# Altium project Pukk-Sensor-Module-v1.0.PrjPcb (part 4 of 6)

## Sheet CAN-Sheet.SchDoc
size 420 x 297 mm; SheetNumber: 6; SheetTotal: 8
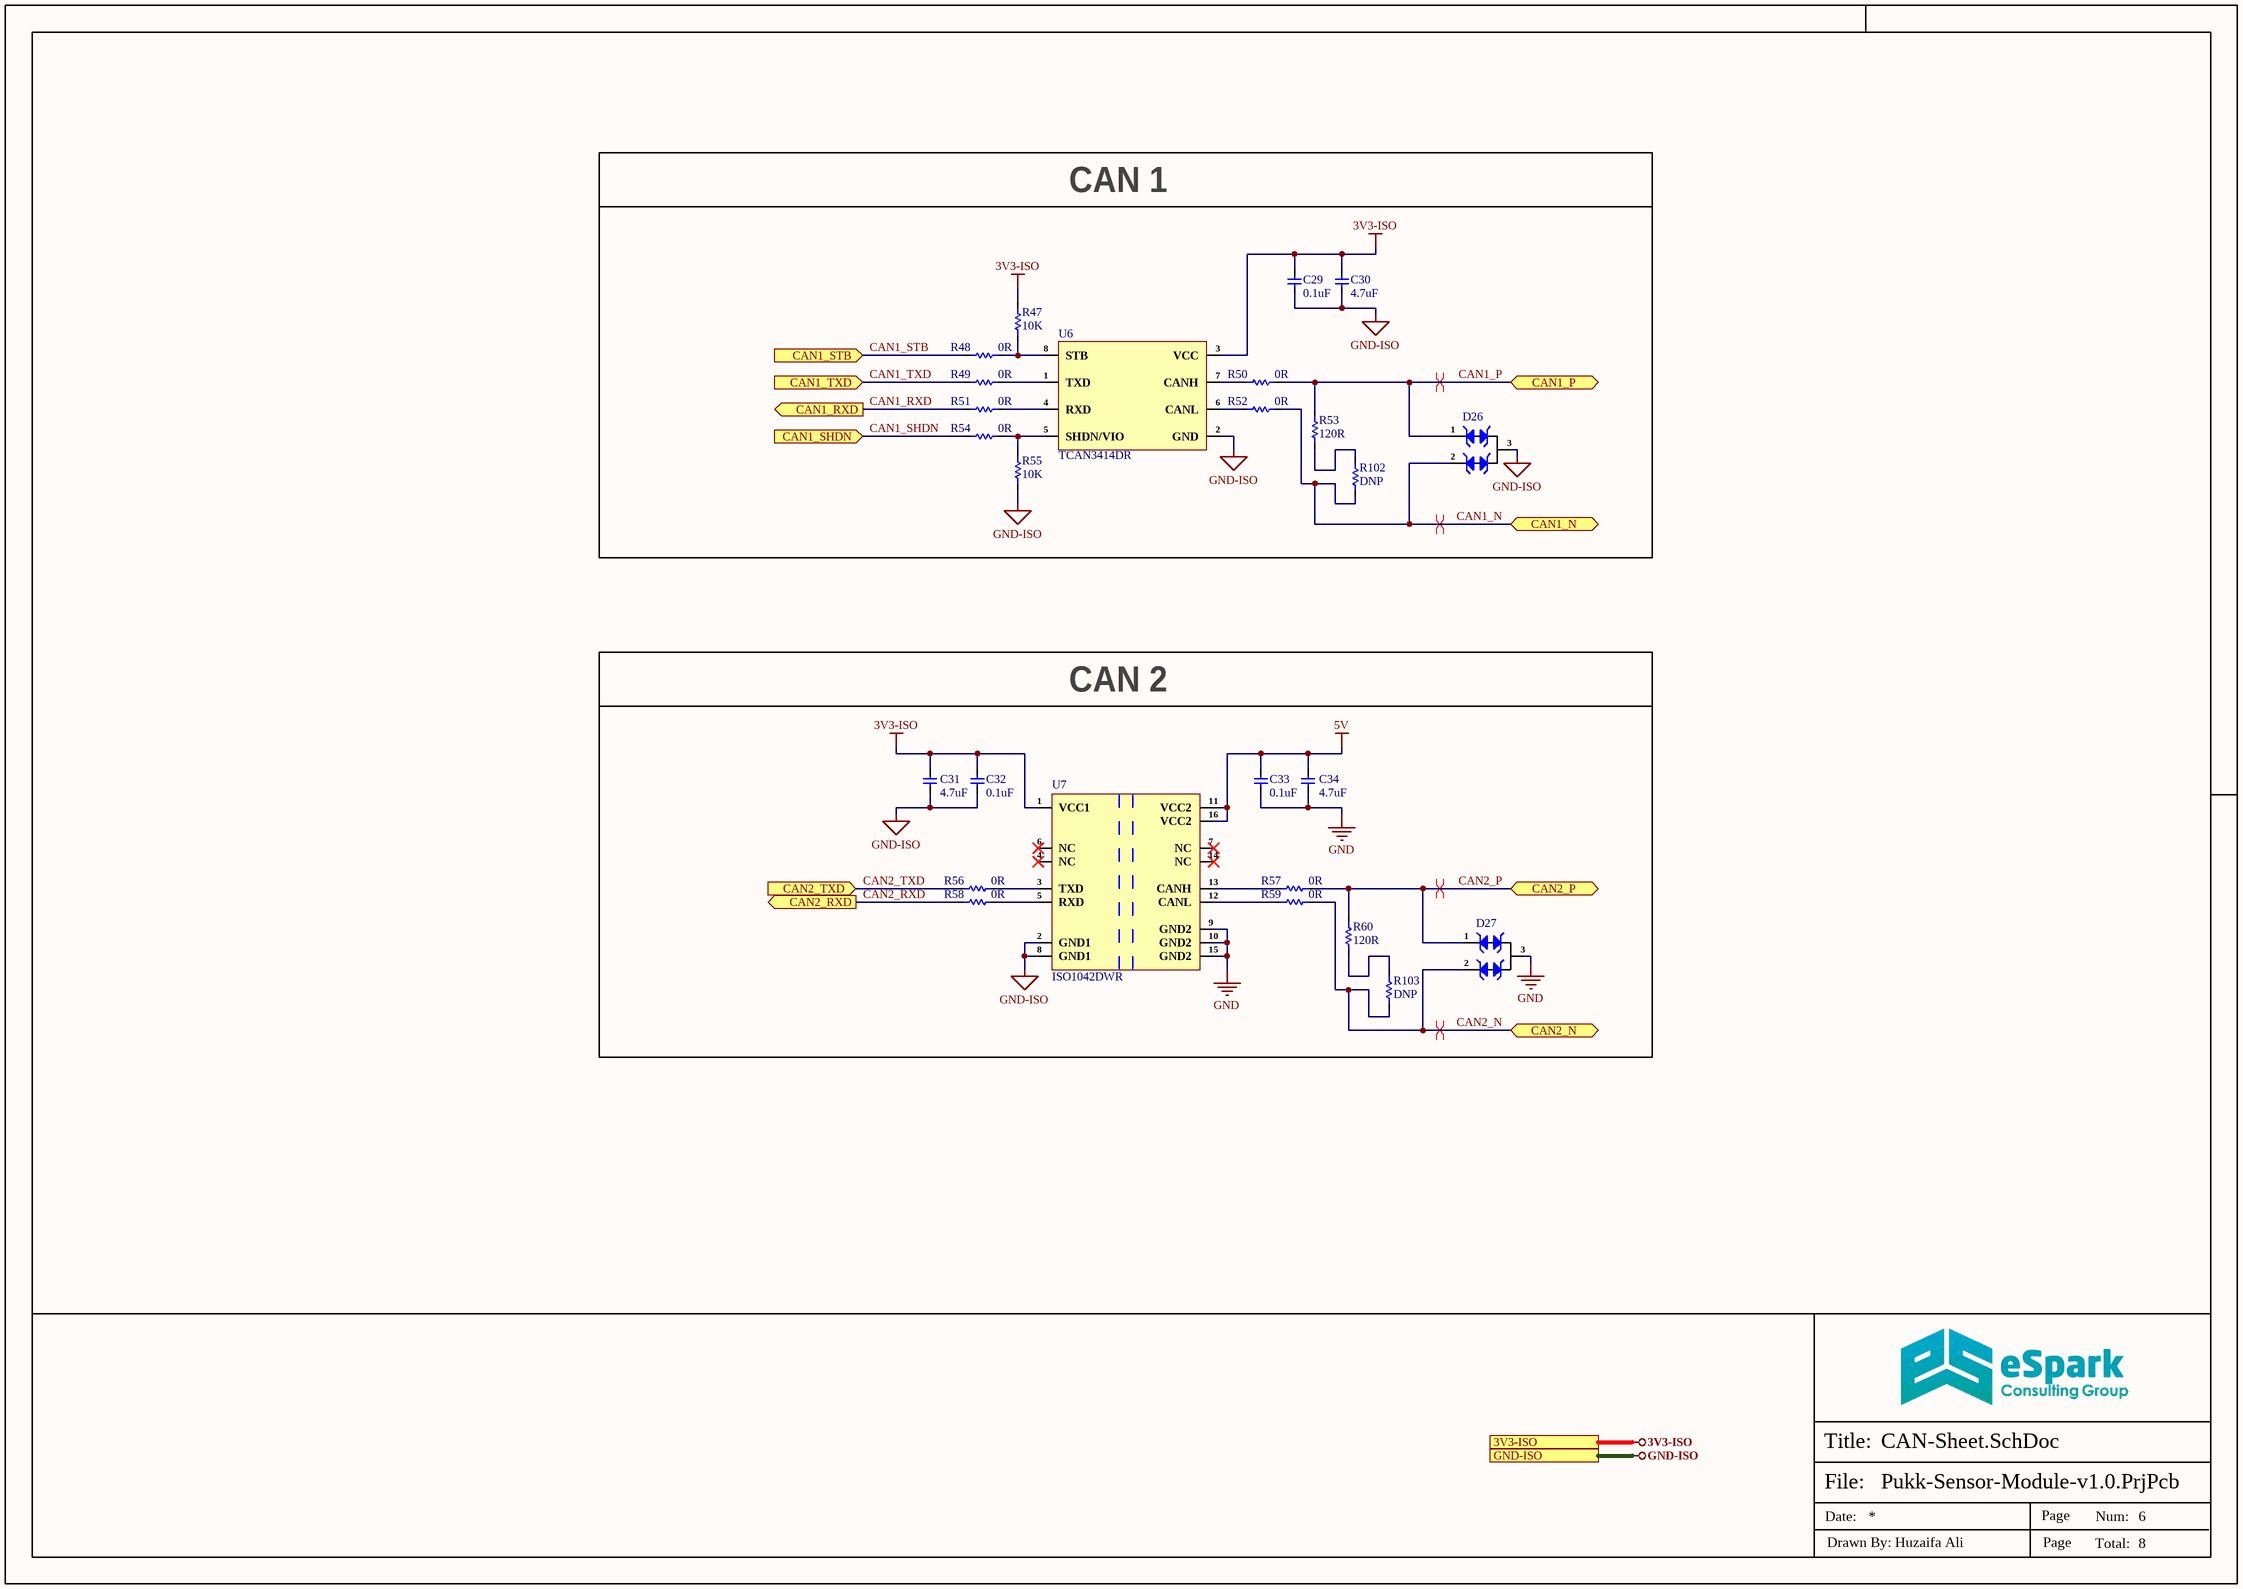
[diagram p5: CAN-Sheet.SchDoc]

### Parts
C29  0.1uF  [Cap-0402]
C30  4.7uF  [Cap-0402]
C31  4.7uF  [Cap-0603]
C32  0.1uF  [Cap-0402]
C33  0.1uF  [Cap-0402]
C34  4.7uF  [Cap-0603]
D26  CDSOT23-T24CAN-Q  [SOT-23]  (value not drawn)
D27  CDSOT23-T24CAN-Q  [SOT-23]  (value not drawn)
R47  10K  [Res-0402]
R48  0R  [Res-0402]
R49  0R  [Res-0402]
R50  0R  [Res-0402]
R51  0R  [Res-0402]
R52  0R  [Res-0402]
R53  120R  [Res-0603]
R54  0R  [Res-0402]
R55  10K  [Res-0402]
R56  0R  [Res-0402]
R57  0R  [Res-0402]
R58  0R  [Res-0402]
R59  0R  [Res-0402]
R60  120R  [Res-0603]
R102  DNP  [Res-0603]
R103  DNP  [Res-0603]
U6  TCAN3414DR  [SOIC-8(0.154", 3.90mm Width)]
U7  ISO1042DWR  [SOIC-16-300mil]

### Blocks framed on the sheet
CAN 1: C29 C30 D26 R47-R55 R102 U6
CAN 2: C31-C34 D27 R56-R60 R103 U7

### Ports
3V3-ISO (see Top-Sheet[5A], Controller-Sheet-1[4D], Controller-Sheet-2[4D], Power-Sheet[4D], Sensors-Sheet[1D]), CAN1_N (bidir, see Top-Sheet[5A], Connector-Sheet[2B]), CAN1_P (bidir, see Top-Sheet[5A], Connector-Sheet[2B]), CAN1_RXD (out, see Top-Sheet[5A]), CAN1_SHDN (in, see Top-Sheet[5A]), CAN1_STB (in, see Top-Sheet[5A]), CAN1_TXD (in, see Top-Sheet[5A]), CAN2_N (bidir, see Top-Sheet[5B], Connector-Sheet[2B]), CAN2_P (bidir, see Top-Sheet[5B], Connector-Sheet[2B]), CAN2_RXD (out, see Top-Sheet[5B]), CAN2_TXD (in, see Top-Sheet[5B]), GND-ISO (see Top-Sheet[5A], Controller-Sheet-1[4D], Controller-Sheet-2[4D], Power-Sheet[4D], Sensors-Sheet[1D], USB-Sheet[4D])

### Nets
3V3-ISO: C29.2 C30.2 C31.2 C32.2 R47.2 U6.3(VCC) U7.1(VCC1) ; port 3V3-ISO
5V: C33.2 C34.2 U7.11(VCC2) U7.16(VCC2)
GND: C33.1 C34.1 D27.3 U7.9(GND2) U7.10(GND2) U7.15(GND2)
GND-ISO: C29.1 C30.1 C31.1 C32.1 D26.3 R55.1 U6.2(GND) U7.2(GND1) U7.8(GND1) ; port GND-ISO
CAN1_N: D26.2 R52.2 R102.1 ; port CAN1_N
CAN1_P: D26.1 R50.2 R53.2 ; port CAN1_P
CAN1_RXD: R51.1 ; port CAN1_RXD
CAN1_SHDN: R54.1 ; port CAN1_SHDN
CAN1_STB: R48.1 ; port CAN1_STB
CAN1_TXD: R49.1 ; port CAN1_TXD
CAN2_N: D27.2 R59.2 R103.1 ; port CAN2_N
CAN2_P: D27.1 R57.2 R60.2 ; port CAN2_P
CAN2_RXD: R58.1 ; port CAN2_RXD
CAN2_TXD: R56.1 ; port CAN2_TXD
NetR47_1: R47.1 R48.2 U6.8(STB)
NetR49_2: R49.2 U6.1(TXD)
NetR50_1: R50.1 U6.7(CANH)
NetR51_2: R51.2 U6.4(RXD)
NetR52_1: R52.1 U6.6(CANL)
NetR53_1: R53.1 R102.2
NetR54_2: R54.2 R55.2 U6.5(SHDN/VIO)
NetR56_2: R56.2 U7.3(TXD)
NetR57_1: R57.1 U7.13(CANH)
NetR58_2: R58.2 U7.5(RXD)
NetR59_1: R59.1 U7.12(CANL)
NetR60_1: R60.1 R103.2

Not connected (* = marked no-connect by the designer): U7 4(NC)* 6(NC)* 7(NC)* 14(NC)*

### Layout directives
differential pair; differential pair class CAN: CAN1_N, CAN1_P, CAN2_N, CAN2_P

### Notes on the sheet
- File:
- Title:
- Date:
- Page
- Num:
- Total:
- Drawn By: Huzaifa Ali

### Library data of the parts
C29 C32 C33 = CC0402JRX7R7BB104: CAP CER 0.1UF 16V X7R 0402; Manufacturer: Yageo; Material: 4241ConductorMaterial; Value: 100nF; Tolerance: 5%; Item Type: Capacitor; Supplier: Digikey; Supplier Part Number: 311-1676-1-ND; Manufacturer Part Number: CC0402JRX7R7BB104; RoHS: Yes; Category: Ceramic Capacitors; Stock: 1659111; Pricing: 1=0.1, 10=0.046, 50=0.0262, 100=0.0203, 500=0.01528, 1000=0.012, 2500=0.01091, 5000=0.01004 (USD); Mounting Technology: Surface Mount; Case/Package: 0402; Case Code (Metric): 1005; Case Code (Imperial): 0402; Min Operating Temperature: -55°C; Max Operating Temperature: 125°C; Dielectric: X7R; Packaging: Tape and Reel; Package Quantity: 10000; Voltage Rating (DC): 16V; Voltage Rating: 16V; Series: CC; Construction: Flat; Length: 0.039inch; Width: 0.02inch; Height: 0.5mm; Thickness: 0.022inch; Lead Free: Lead Free; Halogen Free: Halogen Free; RoHS Compliant: Yes; ComponentLink1URL: https://datasheet.ciiva.com/13210/upy-gphc-x7r-6-3v-to-50v-8-12304-13210152.pdf?src-supplier=Mouser; ComponentLink1Description: https://datasheet.ciiva.com/13210/upy-gphc-x7r-6-3v-to-50v-8-12304-13210152.pdf?src-supplier=Mouser; LCSC Part Number: C541464
C30 = CC0402KRX5R6BB475: CAP CER 4.7UF 10V X5R 0402; Manufacturer: Yageo; Tolerance: 10%; Supplier 1: Farnell; Manufacturer Part Number: CC0402KRX5R6BB475; RoHS: Yes; Category: Ceramic Capacitors; Stock 1: 20000; Pricing 1: 10000=0.02310, 50000=0.02100 (GBP); Mount: Surface Mount; Case/Package: 0402; Case Code (Imperial): 0402; Case Code (Metric): 1005; Min Operating Temperature: -55°C; Max Operating Temperature: 85°C; Packaging: Cut Tape; Capacitance: 4.7uF; Voltage Rating: 10V; RoHS Compliant: Yes; ComponentLink1URL: http://www.yageo.com/documents/recent/UPY-GPHC_X5R_4V-to-50V_25.pdf?src-supplier=Digi-Key; ComponentLink1Description: http://www.yageo.com/documents/recent/UPY-GPHC_X5R_4V-to-50V_25.pdf?src-supplier=Digi-Key; Supplier Part Number 1: 3871698; LCSC Part Number: C326586
C31 C34 = GRM188R61E475KE11D: CAP CER 4.7UF 25V X5R 0603; Manufacturer: Murata; Tolerance: 10%; Material: Ceramic; LCSC Part Number: C90057; Manufacturer Part Number: GRM188R61E475KE11D; Case/Package: 0603; Case Code (Metric): 1608; Case Code (Imperial): 0603; Min Operating Temperature: -55°C; Max Operating Temperature: 85°C; Voltage Rating: 25V; Packaging: Cut Tape; Package Quantity: 4000; Voltage Rating (DC): 25V; Dielectric: X5R; Length: 1.6mm; Width: 0.031inch; Height: 0.8mm; Depth: 0.8mm; ComponentLink1URL: http://www.farnell.com/datasheets/2048165.pdf?src-supplier=Element14; ComponentLink1Description: http://www.farnell.com/datasheets/2048165.pdf?src-supplier=Element14; ComponentLink2URL: https://www.murata.com/~/media/webrenewal/support/library/catalog/products/capacitor/mlcc/c02e.ashx?la=en-us&src-supplier=Digi-Key; ComponentLink2Description: https://www.murata.com/~/media/webrenewal/support/library/catalog/products/capacitor/mlcc/c02e.ashx?la=en-us&src-supplier=Digi-Key; Supplier 1: Digi-Key; Stock 1: 71618; Pricing 1: 1=0.37, 10=0.258, 100=0.1549, 500=0.1162, 1000=0.09812 (USD); Mount: Surface Mount; Capacitance: 4.7uF; Voltage: 25V; Thickness: 0.031inch; REACH SVHC: No SVHC; Lead Free: Lead Free; Supplier Part Number 1: 490-7203-1-ND
D26 D27 = CDSOT23-T24CAN-Q: TVS DIODE 24VWM 40VC SOT23-3; Manufacturer: Bourns; Item Type: TVS Diodes; Supplier: Digikey; LCSC Part Number: C350941; Manufacturer Part Number: CDSOT23-T24CAN-Q; RoHS: Yes; Stock: 17231; Pricing: 1=0.36, 10=0.282, 100=0.1691, 500=0.15656, 1000=0.10645, 3000=0.098, 6000=0.09393, 9000=0.08454, 30000=0.08328, 75000=0.07827 (USD); RoHS Compliant: 5897YesNo; ComponentLink1URL: http://www.farnell.com/datasheets/2372435.pdf?src-supplier=Farnell; ComponentLink1Description: http://www.farnell.com/datasheets/2372435.pdf?src-supplier=Farnell; ComponentLink2URL: https://www.bourns.com/docs/Product-Datasheets/cdsot23-t24can-Q.pdf?src-supplier=Digikey; ComponentLink2Description: https://www.bourns.com/docs/Product-Datasheets/cdsot23-t24can-Q.pdf?src-supplier=Digikey; ComponentLink3URL: http://www.farnell.com/datasheets/2372435.pdf?src-supplier=Newark; ComponentLink3Description: http://www.farnell.com/datasheets/2372435.pdf?src-supplier=Newark
R47 R55 = RC0402FR-0710KL: RES 10K OHM 1% 1/16W 0402; Manufacturer: Yageo; Resistance: 10kR; Voltage Rating (DC): 50V; Temperature Coefficient: 100ppm/°C; Power Rating: 62.5mW; Max Power Dissipation: 63mW; Item Type: Resistor; Supplier 1: Mouser; Manufacturer Part Number: RC0402FR-0710KL; RoHS: Yes; Category: Chip SMD Resistors; Stock 1: 18648329; Pricing 1: 1=0.10000, 10=0.01400, 50=0.01400, 100=0.00500, 1000=0.00300, 10000=0.00200 (USD); Case/Package: 0402; Number of Pins: 2; Case Code (Imperial): 0402; Case Code (Metric): 1005; Min Operating Temperature: -55°C; Max Operating Temperature: 155°C; Resistor Type: Thick Film; Tolerance: 1%; Packaging: Tape and Reel; Voltage Rating: 50V; Termination: SMD/SMT; Working Voltage: 50V; Number of Terminations: 2; Features: Moisture Resistant; Series: RC; Resistance Tolerance: 1%; Construction: Rectangular; Length: 1mm; Width: 0.5mm; Height: 0.32mm; Depth: 0.5mm; Lead Pitch: 0.2mm; REACH SVHC: No SVHC; Lead Free: Lead Free; RoHS Compliant: Yes; Military Standard: Not; ComponentLink1URL: https://datasheet.ciiva.com/7660/38568-7660787.pdf?src-supplier=Element14; ComponentLink1Description: https://datasheet.ciiva.com/7660/38568-7660787.pdf?src-supplier=Element14; ComponentLink2URL: https://datasheet.ciiva.com/7849/1686128-7849814.pdf?src-supplier=Element14; ComponentLink2Description: https://datasheet.ciiva.com/7849/1686128-7849814.pdf?src-supplier=Element14; ComponentLink3URL: https://datasheet.ciiva.com/7983/1018594-7983486.pdf?src-supplier=Element14; ComponentLink3Description: https://datasheet.ciiva.com/7983/1018594-7983486.pdf?src-supplier=Element14; ComponentLink4URL: https://datasheet.ciiva.com/22747/1018594-22747512.pdf?src-supplier=Element14; ComponentLink4Description: https://datasheet.ciiva.com/22747/1018594-22747512.pdf?src-supplier=Element14; ComponentLink5URL: https://datasheet.ciiva.com/12667/pyu-rc0402-51-rohs-l-6-r-12667067.pdf?src-supplier=Mouser; ComponentLink5Description: https://datasheet.ciiva.com/12667/pyu-rc0402-51-rohs-l-6-r-12667067.pdf?src-supplier=Mouser; ComponentLink6URL: https://datasheet.ciiva.com/7849/1784430-7849813.pdf?src-supplier=Element14; ComponentLink6Description: https://datasheet.ciiva.com/7849/1784430-7849813.pdf?src-supplier=Element14; ComponentLink7URL: https://datasheet.ciiva.com/7849/1784430-7849815.pdf?src-supplier=Element14; ComponentLink7Description: https://datasheet.ciiva.com/7849/1784430-7849815.pdf?src-supplier=Element14; Supplier Part Number 1: 603-RC0402FR-0710KL; LCSC Part Number: C60490
R48-R52 R54 R56-R59 = RC0402FR-070RL: RES 0 OHM JUMPER 1/16W 0402; Manufacturer: Yageo; Item Type: Resistors; Tolerance: 1%; Power Rating: 62.5mW; Voltage Rating: 50V; Temperature Coefficient: 200ppm/°C; Max Power Dissipation: 63mW; Supplier 1: Mouser; Manufacturer Part Number: RC0402FR-070RL; RoHS: Yes; Stock 1: 8556842; Pricing 1: 1=0.10000, 10=0.01400, 50=0.01400, 100=0.00600, 1000=0.00300, 5000=0.00200, 10000=0.00100 (USD); Mount: Surface Mount; Case/Package: 0402; Contact Plating: Tin,Matte; Case Code (Imperial): 0402; Case Code (Metric): 1005; Size Code: 0402; Min Operating Temperature: -55°C; Max Operating Temperature: 155°C; Resistance: 0R; Resistor Type: Thick Film; Packaging: Tape and Reel; Termination: SMD/SMT; Features: Moisture Resistant; Series: RC; Number of Terminations: 2; Length: 1mm; Width: 0.5mm; Height: 0.35mm; Radiation Hardening: No; Lead Free: Lead Free; RoHS Compliant: Yes; ComponentLink1URL: https://datasheet.ciiva.com/8896/pyu-rc0402-51-rohs-l-6-8896149.pdf?src-supplier=Avnet; ComponentLink1Description: https://datasheet.ciiva.com/8896/pyu-rc0402-51-rohs-l-6-8896149.pdf?src-supplier=Avnet; ComponentLink2URL: https://datasheet.ciiva.com/16790/pyu-rc0402-51-rohs-l-6-r-16790444.pdf?src-supplier=Future+Electronics; ComponentLink2Description: https://datasheet.ciiva.com/16790/pyu-rc0402-51-rohs-l-6-r-16790444.pdf?src-supplier=Future+Electronics; Supplier Part Number 1: 603-RC0402FR-070RL; LCSC Part Number: C106231
R53 R60 = RC0603FR-07120RL: RES 120 OHM 1% 1/10W 0603; Manufacturer: Yageo; Temperature Coefficient: 100ppm/°C; Voltage Rating (DC): 50V; Power Rating: 100mW; Item Type: Resistor; Supplier 1: Digi-Key; Manufacturer Part Number: RC0603FR-07120RL; RoHS: Yes; Category: Chip SMD Resistors; Stock 1: 839061; Pricing 1: 1=0.10000, 10=0.02400, 100=0.00970, 1000=0.00436, 2500=0.00378 (USD); Case/Package: 0603; Number of Pins: 2; Case Code (Metric): 1608; Case Code (Imperial): 0603; Size Code: 0603; Min Operating Temperature: -55°C; Max Operating Temperature: 155°C; Resistance: 120R; Tolerance: 1%; Resistor Type: Thick Film; Packaging: Tape and Reel; Voltage Rating: 50V; Package Quantity: 1; Number of Terminations: 2; Termination: SMD/SMT; Max Power Dissipation: 100mW; Features: Moisture Resistant; Series: RC; Construction: Rectangular; Resistance Tolerance: 1%; Length: 1.6mm; Width: 0.031inch; Height: 0.022inch; Depth: 0.8mm; REACH SVHC: No SVHC; Lead Free: Lead Free; Military Standard: Not; RoHS Compliant: Yes; ComponentLink1URL: https://datasheet.ciiva.com/2553/pyu-r-int-thick-7-2553512.pdf?src-supplier=Digi-Key; ComponentLink1Description: https://datasheet.ciiva.com/2553/pyu-r-int-thick-7-2553512.pdf?src-supplier=Digi-Key; ComponentLink2URL: https://datasheet.ciiva.com/7746/443971-7746248.pdf?src-supplier=Element14; ComponentLink2Description: https://datasheet.ciiva.com/7746/443971-7746248.pdf?src-supplier=Element14; ComponentLink3URL: https://datasheet.ciiva.com/2553/pyu-r-int-thick-7-2553513.pdf?src-supplier=Digi-Key; ComponentLink3Description: https://datasheet.ciiva.com/2553/pyu-r-int-thick-7-2553513.pdf?src-supplier=Digi-Key; ComponentLink4URL: https://datasheet.ciiva.com/7746/443971-7746249.pdf?src-supplier=Element14; ComponentLink4Description: https://datasheet.ciiva.com/7746/443971-7746249.pdf?src-supplier=Element14; ComponentLink5URL: https://datasheet.ciiva.com/2553/pyu-r-int-thick-7-2553514.pdf?src-supplier=Digi-Key; ComponentLink5Description: https://datasheet.ciiva.com/2553/pyu-r-int-thick-7-2553514.pdf?src-supplier=Digi-Key; ComponentLink6URL: https://datasheet.ciiva.com/46395/443971-46395021.pdf?src-supplier=Element14; ComponentLink6Description: https://datasheet.ciiva.com/46395/443971-46395021.pdf?src-supplier=Element14; Supplier Part Number 1: 311-120HRCT-ND; LCSC Part Number: C114640
R102 R103 = RC0603JR-070RL: RES 0 OHM JUMPER 1/10W 0603; Manufacturer: Yageo; Item Type: Resistor; Resistance: 0mR; Tolerance: 1%; Power Rating: 100mW; Voltage Rating: 50V; Temperature Coefficient: 200ppm/°C; Resistance Tolerance: 5%; Supplier 1: Digi-Key; Manufacturer Part Number: RC0603JR-070RL; RoHS: Yes; Stock 1: 18081776; Pricing 1: 1=0.10000, 10=0.01700, 25=0.01240, 50=0.00960, 100=0.00700, 250=0.00536, 500=0.00430, 1000=0.00316 (USD); Case/Package: 0603; Contact Plating: Tin,Matte; Case Code (Imperial): 0603; Case Code (Metric): 1608; Size Code: 0603; Min Operating Temperature: -55°C; Max Operating Temperature: 155°C; Resistor Type: Thick Film; Packaging: Tape and Reel; Termination: SMD/SMT; Features: Moisture Resistant; Series: RC; Max Power Dissipation: 100mW; Number of Terminations: 2; Length: 1.6mm; Width: 0.8mm; Height: 0.45mm; Radiation Hardening: No; Lead Free: Lead Free; RoHS Compliant: Yes; Supplier Part Number 1: 311-0.0GRCT-ND; LCSC Part Number: C95177; Category: Chip SMD Resistors; Number of Pins: 2; Voltage Rating (DC): 50V; Technology: THICK FILM; Package Quantity: 5000; Construction: Rectangular; Depth: 0.8mm; Reach SVHC Compliant: No SVHC; Military Standard: Not
U6 = TCAN3414DR: IC TRANSCEIVER HALF 1/1 8SOIC; Manufacturer: Texas Instruments; Supplier: Mouser; LCSC Part Number: C22396693; Manufacturer Part Number: TCAN3414DR; RoHS: No; Item Type: IC; Stock: 201; Pricing: 1=1.55, 10=1.1, 50=1.1, 100=0.895, 1000=0.763, 10000=0.681 (USD); Case/Package: SOIC; Pins: 8; Length: 4.9mm; Width: 3.91mm; Height: 1.75mm; Thickness: 1.58mm
U7 = ISO1042DWR: IC TRANSCEIVER FULL 1/1 16SOIC; Manufacturer: Texas Instruments; Supplier: Mouser; LCSC Part Number: C1848126; Manufacturer Part Number: ISO1042DWR; RoHS: Yes; Item Type: IC; Stock: 2008; Pricing: 1=3.75, 10=2.83, 50=2.6, 100=2.35, 1000=2.09, 10000=1.92 (USD); ComponentLink1URL: http://www.ti.com/lit/gpn/iso1042?src-supplier=Digikey; ComponentLink1Description: http://www.ti.com/lit/gpn/iso1042?src-supplier=Digikey

## Sheet Sensors-Sheet.SchDoc
size 420 x 297 mm; SheetNumber: 7; SheetTotal: 8
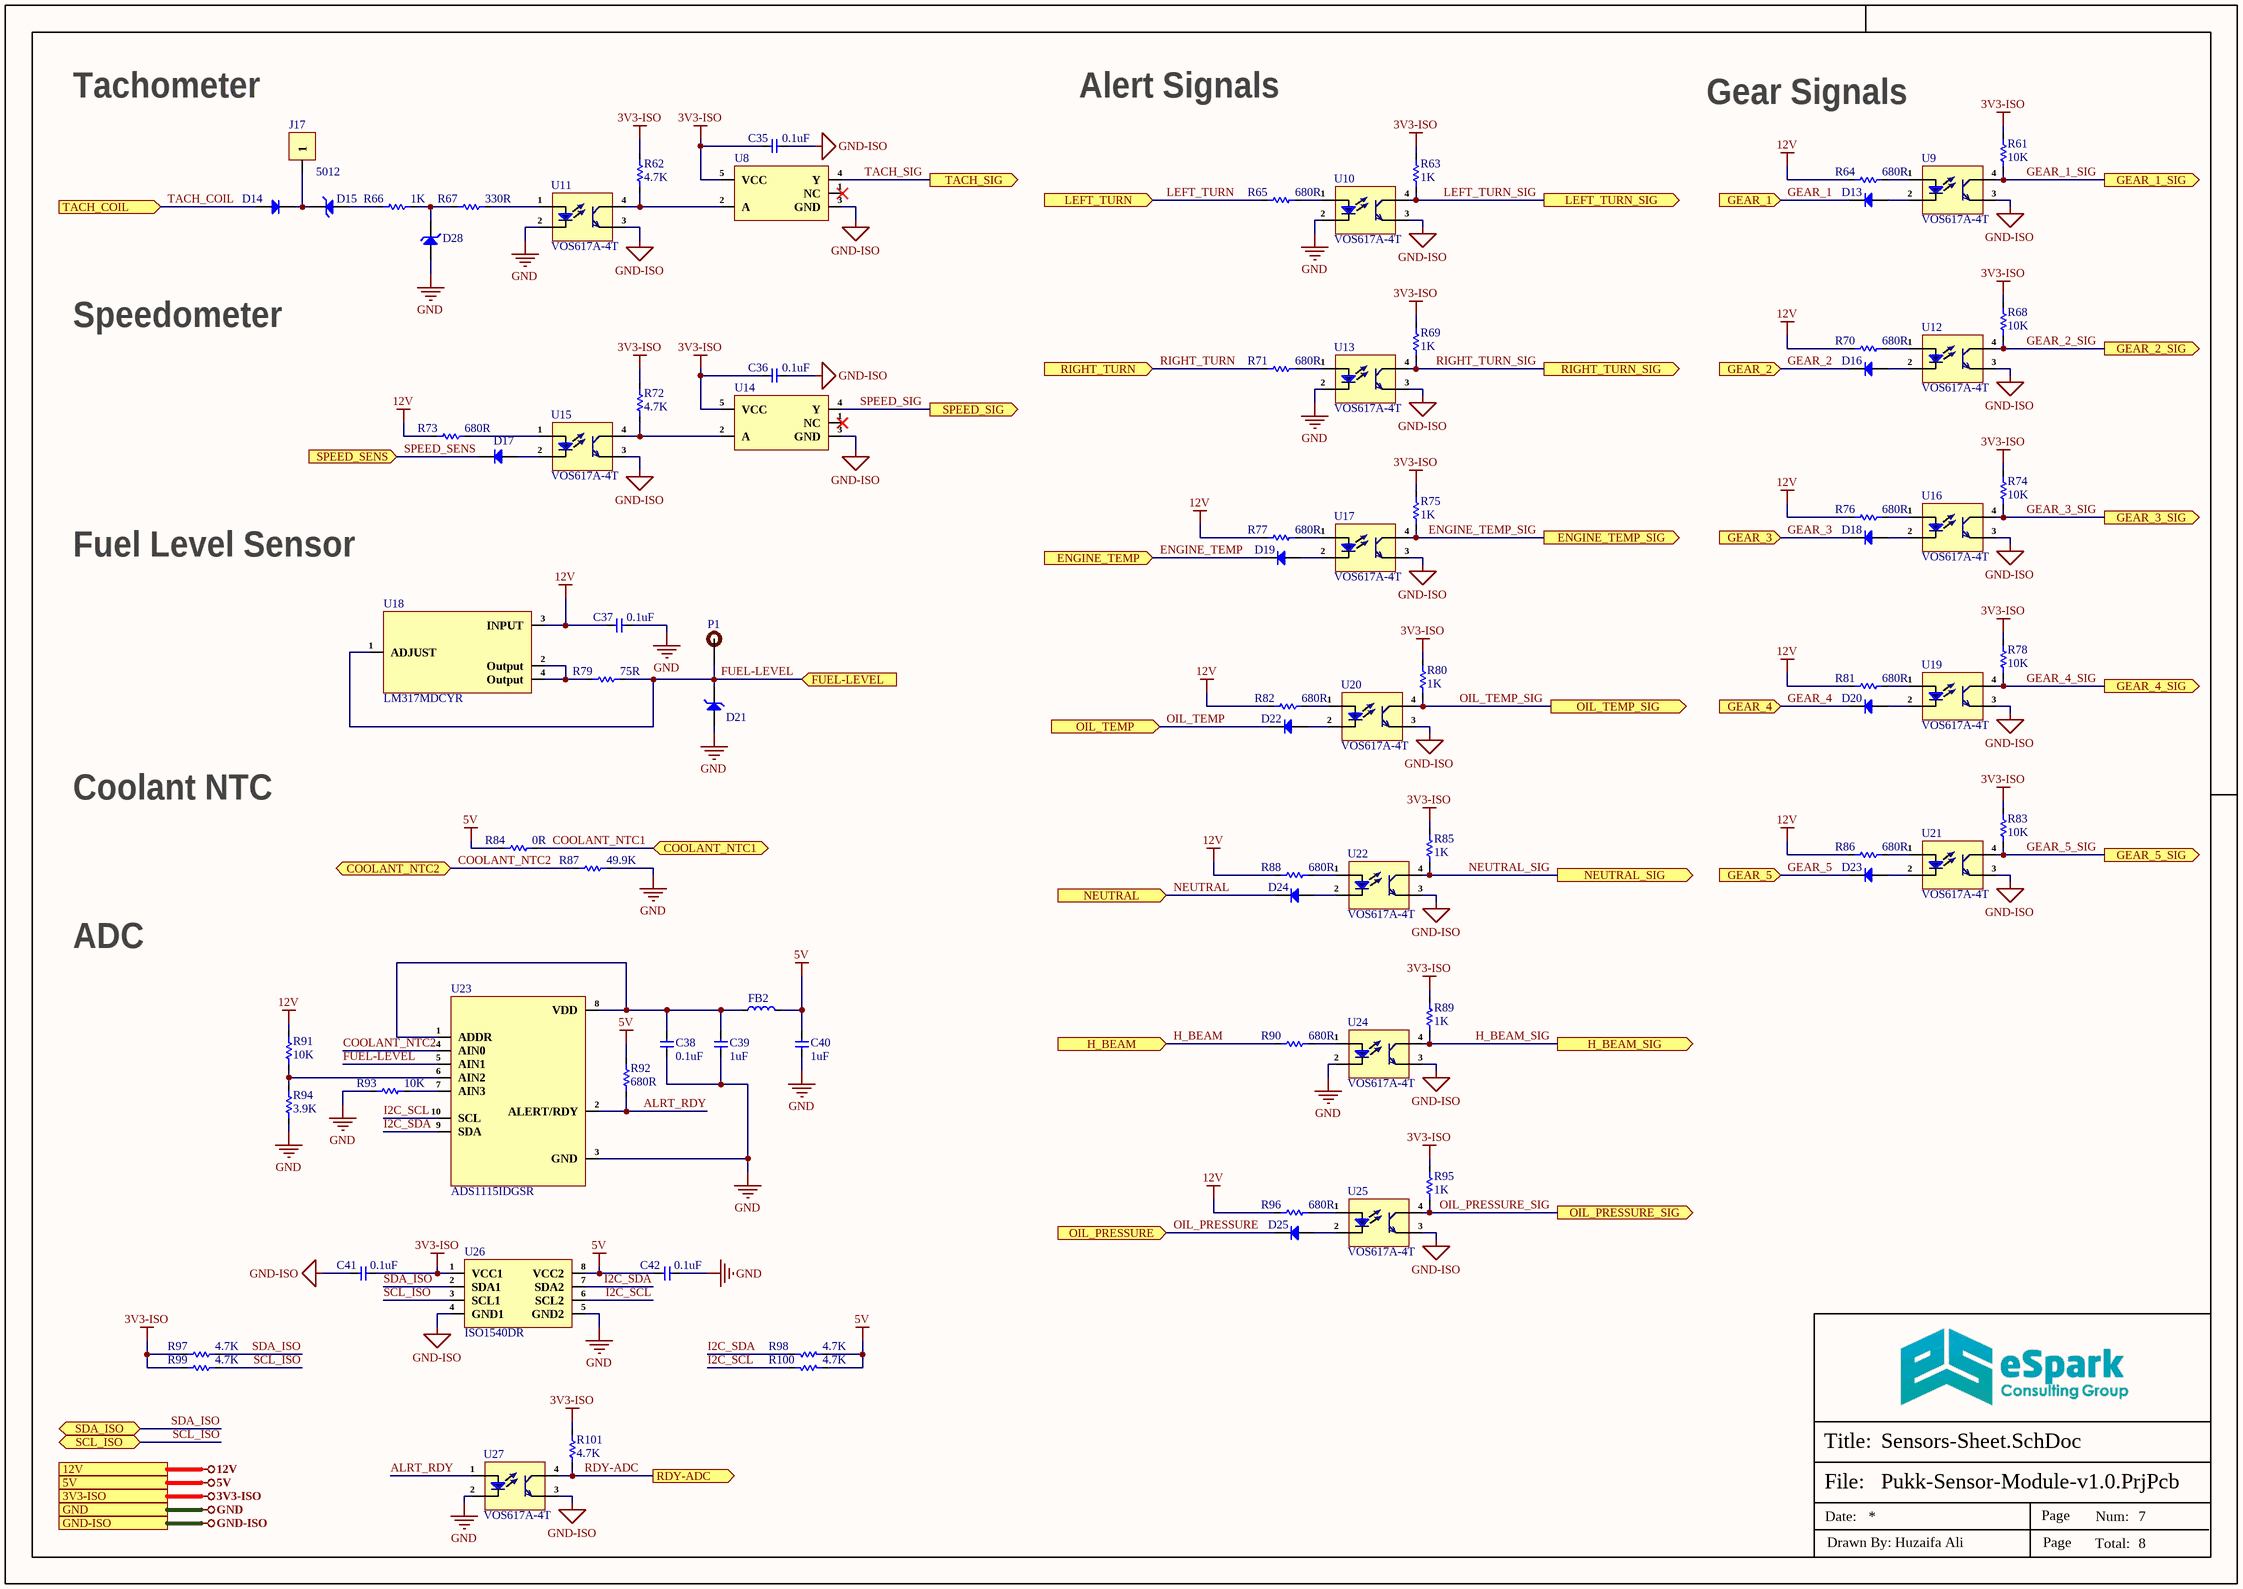
[diagram p6: Sensors-Sheet.SchDoc]

### Parts
C35  0.1uF  [Cap-0402]
C36  0.1uF  [Cap-0402]
C37  0.1uF  [Cap-0402]
C38  0.1uF  [Cap-0402]
C39  1uF  [Cap-0402]
C40  1uF  [Cap-0402]
C41  0.1uF  [Cap-0402]
C42  0.1uF  [Cap-0402]
D13  1N4148W  [SOD-123]  (value not drawn)
D14  ES1B  [SMA(DO-214AC)]  (value not drawn)
D15  1SMB5949BT3G  [SMB_]  (value not drawn)
D16  1N4148W  [SOD-123]  (value not drawn)
D17  1N4148W-7-F  [SOD-123]  (value not drawn)
D18  1N4148W  [SOD-123]  (value not drawn)
D19  1N4148W  [SOD-123]  (value not drawn)
D20  1N4148W  [SOD-123]  (value not drawn)
D21  MSP3V3HM3/89A  [MicroSMP]  (value not drawn)
D22  1N4148W  [SOD-123]  (value not drawn)
D23  1N4148W  [SOD-123]  (value not drawn)
D24  1N4148W  [SOD-123]  (value not drawn)
D25  1N4148W  [SOD-123]  (value not drawn)
D28  1SMA4755A  [SMA]  (value not drawn)
FB2  MMZ2012R102ATD25  [Ind-0805]  (value not drawn)
J17  5012  [5012]
P1  TEST POINT 0.5mm Dia  [Test-point - 0.5mm]  (value not drawn)  (no BOM)
R61  10K  [Res-0402]
R62  4.7K  [Res-0402]
R63  1K  [Res-0402]
R64  680R  [Res-0402]
R65  680R  [Res-0402]
R66  1K  [Res-1206]
R67  330R  [Res-1206]
R68  10K  [Res-0402]
R69  1K  [Res-0402]
R70  680R  [Res-0402]
R71  680R  [Res-0402]
R72  4.7K  [Res-0402]
R73  680R  [Res-0402]
R74  10K  [Res-0402]
R75  1K  [Res-0402]
R76  680R  [Res-0402]
R77  680R  [Res-0402]
R78  10K  [Res-0402]
R79  75R  [Res-0603]
R80  1K  [Res-0402]
R81  680R  [Res-0402]
R82  680R  [Res-0402]
R83  10K  [Res-0402]
R84  0R  [Res-0402]
R85  1K  [Res-0402]
R86  680R  [Res-0402]
R87  49.9K  [Res-0402]
R88  680R  [Res-0402]
R89  1K  [Res-0402]
R90  680R  [Res-0402]
R91  10K  [Res-0603]
R92  680R  [Res-0402]
R93  10K  [Res-0603]
R94  3.9K  [Res-0402]
R95  1K  [Res-0402]
R96  680R  [Res-0402]
R97  4.7K  [Res-0402]
R98  4.7K  [Res-0402]
R99  4.7K  [Res-0402]
R100  4.7K  [Res-0402]
R101  4.7K  [Res-0402]
U8  SN74AHC1G14DBVR  [SOT-23-5]  (value not drawn)
U9  VOS617A-4T  [SOIC-4-175mil]
U10  VOS617A-4T  [SOIC-4-175mil]
U11  VOS617A-4T  [SOIC-4-175mil]
U12  VOS617A-4T  [SOIC-4-175mil]
U13  VOS617A-4T  [SOIC-4-175mil]
U14  SN74AHC1G14DBVR  [SOT-23-5]  (value not drawn)
U15  VOS617A-4T  [SOIC-4-175mil]
U16  VOS617A-4T  [SOIC-4-175mil]
U17  VOS617A-4T  [SOIC-4-175mil]
U18  LM317MDCYR  [SOT- 223]
U19  VOS617A-4T  [SOIC-4-175mil]
U20  VOS617A-4T  [SOIC-4-175mil]
U21  VOS617A-4T  [SOIC-4-175mil]
U22  VOS617A-4T  [SOIC-4-175mil]
U23  ADS1115IDGSR  [VSSOP-10]
U24  VOS617A-4T  [SOIC-4-175mil]
U25  VOS617A-4T  [SOIC-4-175mil]
U26  ISO1540DR  [SOIC-8(0.154", 3.90mm Width)]
U27  VOS617A-4T  [SOIC-4-175mil]

### Ports
3V3-ISO (see Top-Sheet[2B], CAN-Sheet[4D], Controller-Sheet-1[4D], Controller-Sheet-2[4D], Power-Sheet[4D]), 5V (see Top-Sheet[2B], Power-Sheet[4D]), 12V (see Top-Sheet[2B], Power-Sheet[4D]), COOLANT_NTC1 (bidir, see Top-Sheet[2C]), COOLANT_NTC2 (bidir, see Top-Sheet[2C]), ENGINE_TEMP (in, see Top-Sheet[2C]), ENGINE_TEMP_SIG (out, see Top-Sheet[2B]), FUEL-LEVEL (in, see Top-Sheet[2C]), GEAR_1 (in, see Top-Sheet[2C]), GEAR_1_SIG (out, see Top-Sheet[2B]), GEAR_2 (in, see Top-Sheet[2C]), GEAR_2_SIG (out, see Top-Sheet[2B]), GEAR_3 (in, see Top-Sheet[2C]), GEAR_3_SIG (out, see Top-Sheet[2B]), GEAR_4 (in, see Top-Sheet[2C]), GEAR_4_SIG (out, see Top-Sheet[2B]), GEAR_5 (in, see Top-Sheet[2C]), GEAR_5_SIG (out, see Top-Sheet[2B]), GND (see Top-Sheet[2B], Connector-Sheet[4D], Power-Sheet[4D]), GND-ISO (see Top-Sheet[2B], CAN-Sheet[4D], Controller-Sheet-1[4D], Controller-Sheet-2[4D], Power-Sheet[4D], USB-Sheet[4D]), H_BEAM (in, see Top-Sheet[2C]), H_BEAM_SIG (out, see Top-Sheet[2B]), LEFT_TURN (in, see Top-Sheet[2C]), LEFT_TURN_SIG (out, see Top-Sheet[2B]), NEUTRAL (in, see Top-Sheet[2C]), NEUTRAL_SIG (out, see Top-Sheet[2B]), OIL_PRESSURE (in, see Top-Sheet[2C]), OIL_PRESSURE_SIG (out, see Top-Sheet[2B]), OIL_TEMP (in, see Top-Sheet[2C]), OIL_TEMP_SIG (out, see Top-Sheet[2B]), RDY-ADC (out, see Top-Sheet[2B]), RIGHT_TURN (in, see Top-Sheet[2C]), RIGHT_TURN_SIG (out, see Top-Sheet[2B]), SCL_ISO (bidir, see Top-Sheet[2B]), SDA_ISO (bidir, see Top-Sheet[2B]), SPEED_SENS (in, see Top-Sheet[2C]), SPEED_SIG (out, see Top-Sheet[2B]), TACH_COIL (in, see Top-Sheet[2C]), TACH_SIG (out, see Top-Sheet[2B])

### Nets
3V3-ISO: C35.1 C36.1 C41.1 R61.2 R62.2 R63.2 R68.2 R69.2 R72.2 R74.2 R75.2 R78.2 R80.2 R83.2 R85.2 R89.2 R95.2 R97.2 R99.2 R101.1 U8.5(VCC) U14.5(VCC) U26.1(VCC1) ; port 3V3-ISO
5V: C40.2 C42.2 FB2.2 R84.1 R92.2 R98.2 R100.2 U26.8(VCC2) ; port 5V
12V: C37.1 R64.1 R70.1 R73.1 R76.1 R77.1 R81.1 R82.1 R86.1 R88.1 R91.2 R96.1 U18.3(INPUT) ; port 12V
GND: C37.2 C38.1 C39.1 C40.1 C42.1 D21.1(A) D28.2(A) R87.2 R93.2 R94.1 U10.2(Ca) U11.2(Ca) U13.2(Ca) U23.3(GND) U24.2(Ca) U26.5(GND2) U27.2(Ca) ; port GND
GND-ISO: C35.2 C36.2 C41.2 U8.3(GND) U9.3(E) U10.3(E) U11.3(E) U12.3(E) U13.3(E) U14.3(GND) U15.3(E) U16.3(E) U17.3(E) U19.3(E) U20.3(E) U21.3(E) U22.3(E) U24.3(E) U25.3(E) U26.4(GND1) U27.3(E) ; port GND-ISO
ALRT_RDY: R92.1 U23.2(ALERT/RDY) U27.1(An)
COOLANT_NTC1: R84.2 ; port COOLANT_NTC1
COOLANT_NTC2: R87.1 U23.4(AIN0) ; port COOLANT_NTC2
ENGINE_TEMP: D19.2(K) ; port ENGINE_TEMP
ENGINE_TEMP_SIG: R75.1 U17.4(C) ; port ENGINE_TEMP_SIG  [project net DI_PE11]
FUEL-LEVEL: D21.2(K) P1.1 R79.2 U18.1(ADJUST) U23.5(AIN1) ; port FUEL-LEVEL  [project net FUEL]
GEAR_1: D13.2(K) ; port GEAR_1
GEAR_1_SIG: R61.1 U9.4(C) ; port GEAR_1_SIG  [project net DI_PD5]
GEAR_2: D16.2(K) ; port GEAR_2
GEAR_2_SIG: R68.1 U12.4(C) ; port GEAR_2_SIG  [project net DI_PD6]
GEAR_3: D18.2(K) ; port GEAR_3
GEAR_3_SIG: R74.1 U16.4(C) ; port GEAR_3_SIG  [project net DI_PD7]
GEAR_4: D20.2(K) ; port GEAR_4
GEAR_4_SIG: R78.1 U19.4(C) ; port GEAR_4_SIG  [project net DI_PD8]
GEAR_5: D23.2(K) ; port GEAR_5
GEAR_5_SIG: R83.1 U21.4(C) ; port GEAR_5_SIG  [project net DI_PD9]
H_BEAM: R90.1 ; port H_BEAM
H_BEAM_SIG: R89.1 U24.4(C) ; port H_BEAM_SIG  [project net DI_PE8]
I2C_SCL: R100.1 U23.10(SCL) U26.6(SCL2)
I2C_SDA: R98.1 U23.9(SDA) U26.7(SDA2)
LEFT_TURN: R65.1 ; port LEFT_TURN  [project net LEFT]
LEFT_TURN_SIG: R63.1 U10.4(C) ; port LEFT_TURN_SIG  [project net DI_PE13]
NEUTRAL: D24.2(K) ; port NEUTRAL  [project net GR_NEUTRAL]
NEUTRAL_SIG: R85.1 U22.4(C) ; port NEUTRAL_SIG  [project net DI_PE9]
OIL_PRESSURE: D25.2(K) ; port OIL_PRESSURE
OIL_PRESSURE_SIG: R95.1 U25.4(C) ; port OIL_PRESSURE_SIG  [project net DI_PE7]
OIL_TEMP: D22.2(K) ; port OIL_TEMP
OIL_TEMP_SIG: R80.1 U20.4(C) ; port OIL_TEMP_SIG  [project net DI_PE10]
RDY-ADC: R101.2 U27.4(C) ; port RDY-ADC  [project net DI_PC12]
RIGHT_TURN: R71.1 ; port RIGHT_TURN  [project net RIGHT]
RIGHT_TURN_SIG: R69.1 U13.4(C) ; port RIGHT_TURN_SIG  [project net DI_PE12]
SCL_ISO: R99.1 U26.3(SCL1) ; port SCL_ISO  [project net I2C1_SCL]
SDA_ISO: R97.1 U26.2(SDA1) ; port SDA_ISO  [project net I2C1_SDA]
SPEED_SENS: D17.2(K) ; port SPEED_SENS  [project net SNS_SPEED]
SPEED_SIG: U14.4(Y) ; port SPEED_SIG
TACH_COIL: D14.2(A) ; port TACH_COIL
TACH_SIG: U8.4(Y) ; port TACH_SIG
NetC38_2: C38.2 C39.2 FB2.1 U23.1(ADDR) U23.8(VDD)
NetD13_1: D13.1(A) U9.2(Ca)
NetD14_1: D14.1(K) D15.2(K) J17.1
NetD15_1: D15.1(A) R66.1
NetD16_1: D16.1(A) U12.2(Ca)
NetD17_1: D17.1(A) U15.2(Ca)
NetD18_1: D18.1(A) U16.2(Ca)
NetD19_1: D19.1(A) U17.2(Ca)
NetD20_1: D20.1(A) U19.2(Ca)
NetD22_1: D22.1(A) U20.2(Ca)
NetD23_1: D23.1(A) U21.2(Ca)
NetD24_1: D24.1(A) U22.2(Ca)
NetD25_1: D25.1(A) U25.2(Ca)
NetD28_1: D28.1(K) R66.2 R67.1
NetR62_1: R62.1 U8.2(A) U11.4(C)
NetR64_2: R64.2 U9.1(An)
NetR65_2: R65.2 U10.1(An)
NetR67_2: R67.2 U11.1(An)
NetR70_2: R70.2 U12.1(An)
NetR71_2: R71.2 U13.1(An)
NetR72_1: R72.1 U14.2(A) U15.4(C)
NetR73_2: R73.2 U15.1(An)
NetR76_2: R76.2 U16.1(An)
NetR77_2: R77.2 U17.1(An)
NetR79_1: R79.1 U18.2(Output) U18.4(Output)
NetR81_2: R81.2 U19.1(An)
NetR82_2: R82.2 U20.1(An)
NetR86_2: R86.2 U21.1(An)
NetR88_2: R88.2 U22.1(An)
NetR90_2: R90.2 U24.1(An)
NetR91_1: R91.1 R94.2 U23.6(AIN2)
NetR93_1: R93.1 U23.7(AIN3)
NetR96_2: R96.2 U25.1(An)

Not connected (* = marked no-connect by the designer): U8 1(NC)*; U14 1(NC)*

### Notes on the sheet
- Tachometer
- Alert Signals
- Gear Signals
- Speedometer
- Fuel Level Sensor
- Coolant NTC
- ADC
- File:
- Title:
- Date:
- Page
- Num:
- Total:
- Drawn By: Huzaifa Ali